# Altium project Стенд проверки шлейфов.PrjPcb
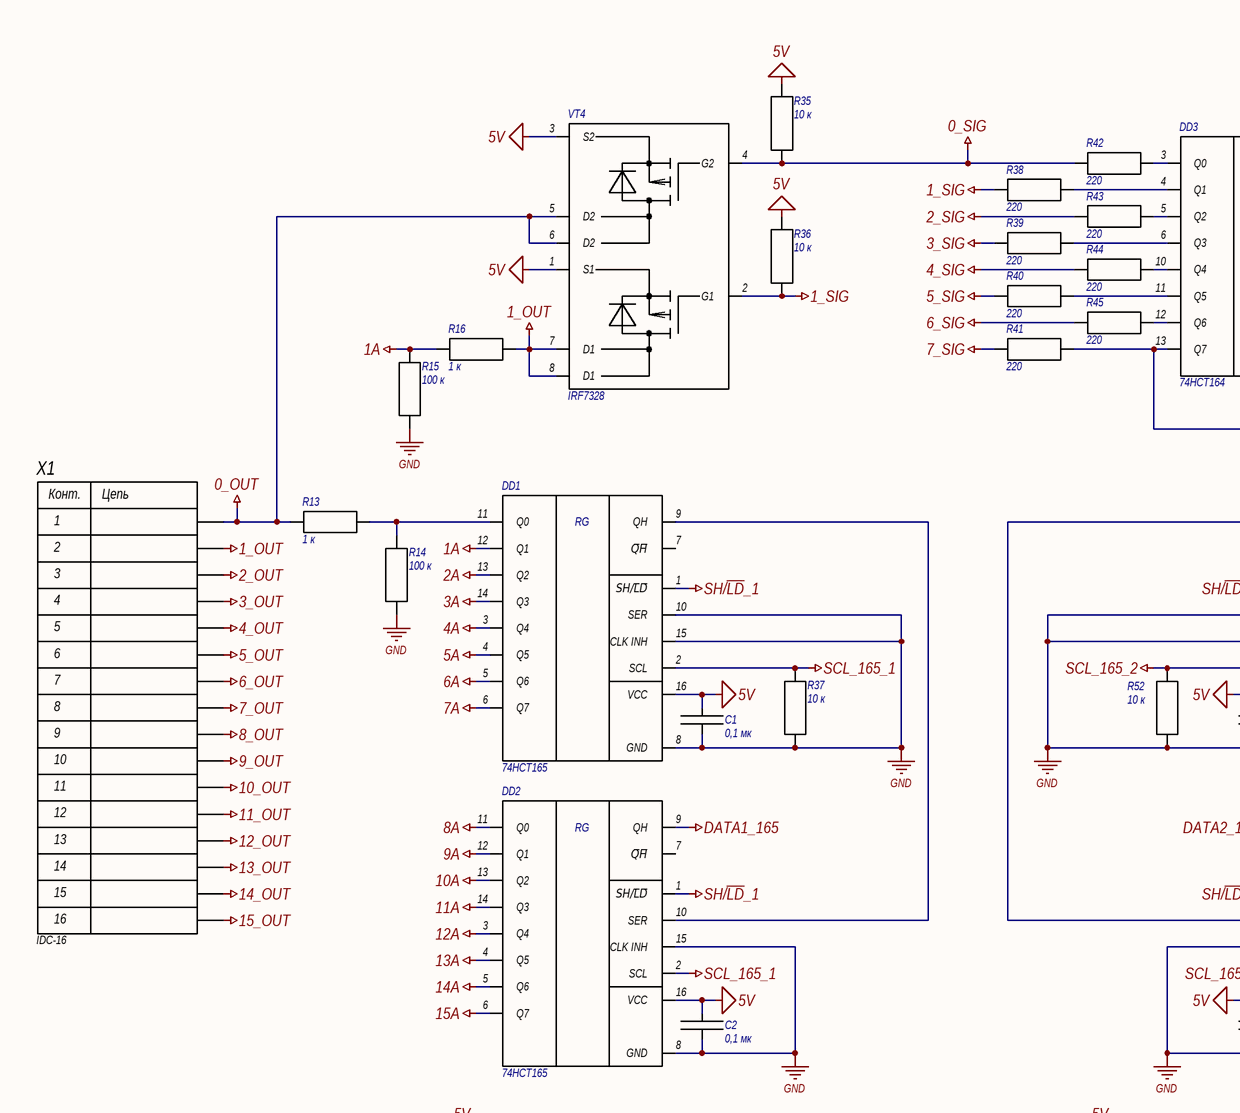
[diagram p0: Схема проверки шлейфа.SchDoc, top left]
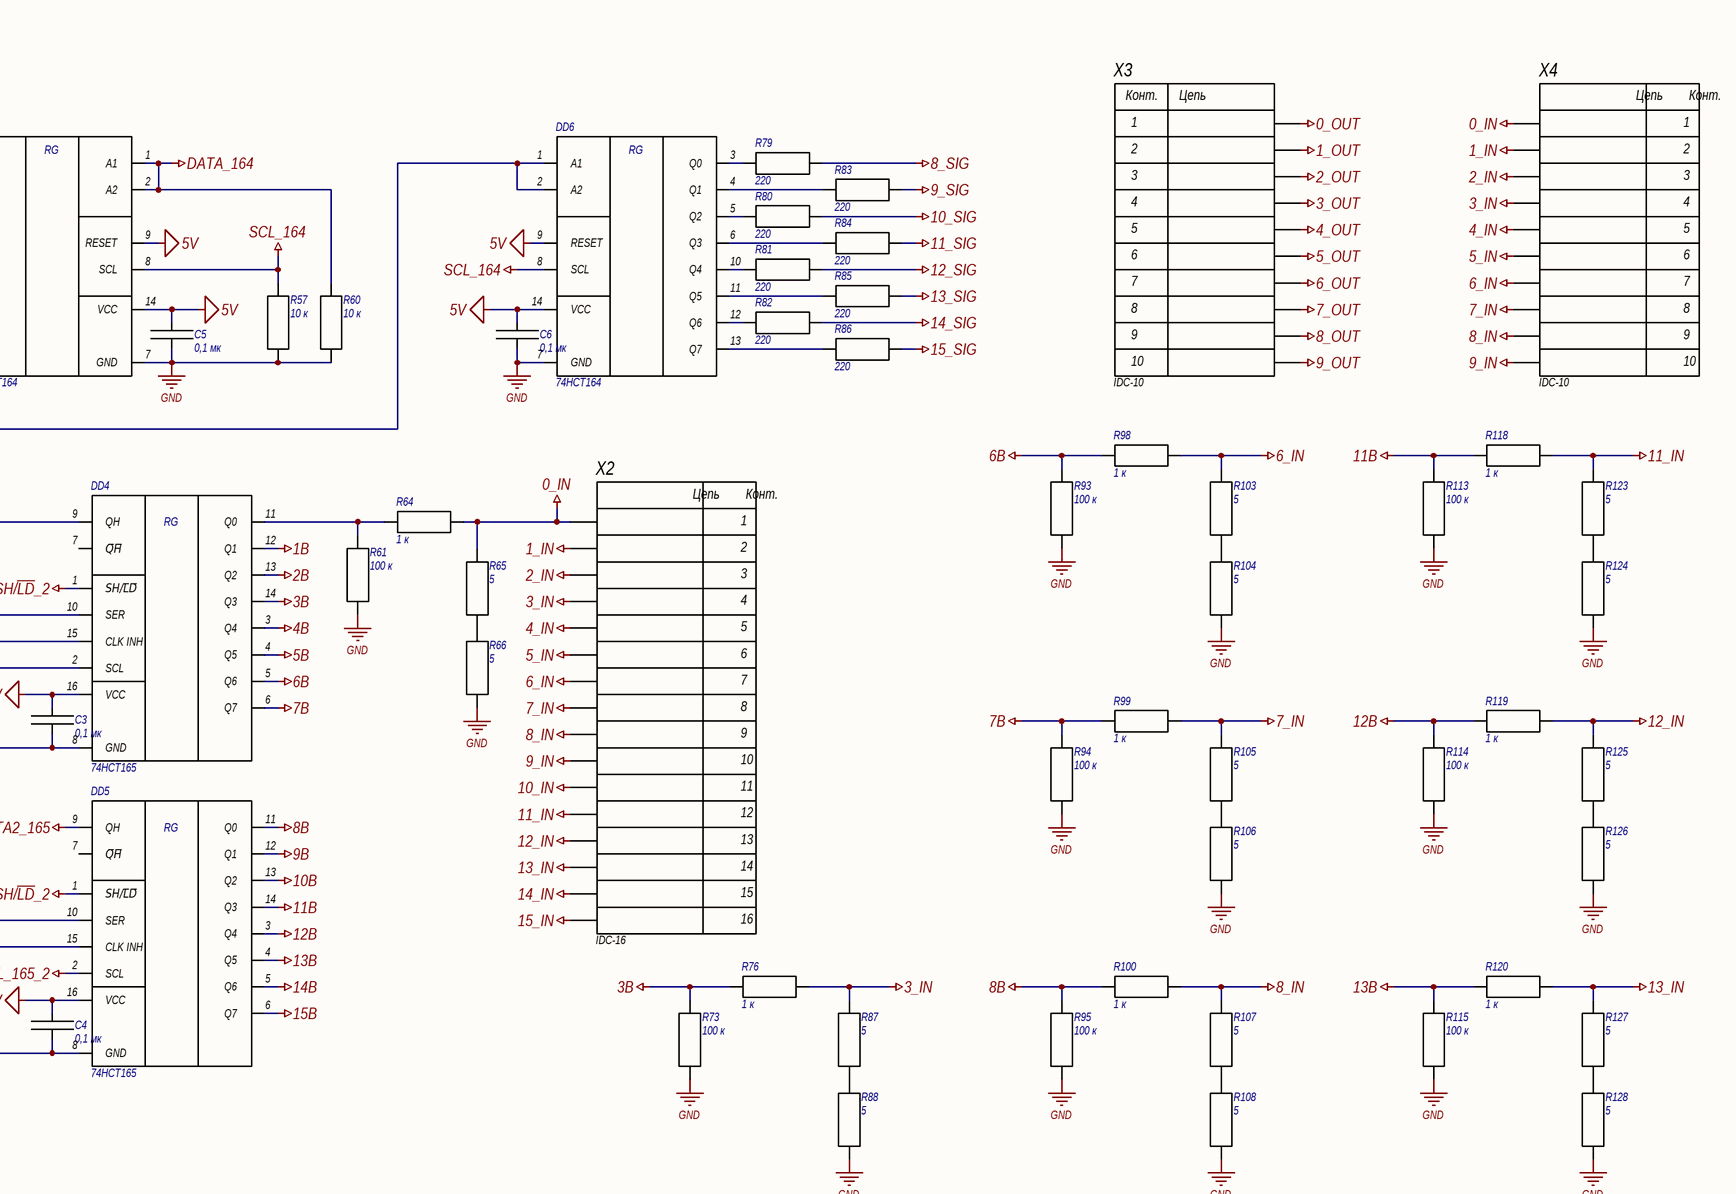
[diagram p1: Схема проверки шлейфа.SchDoc, top right]
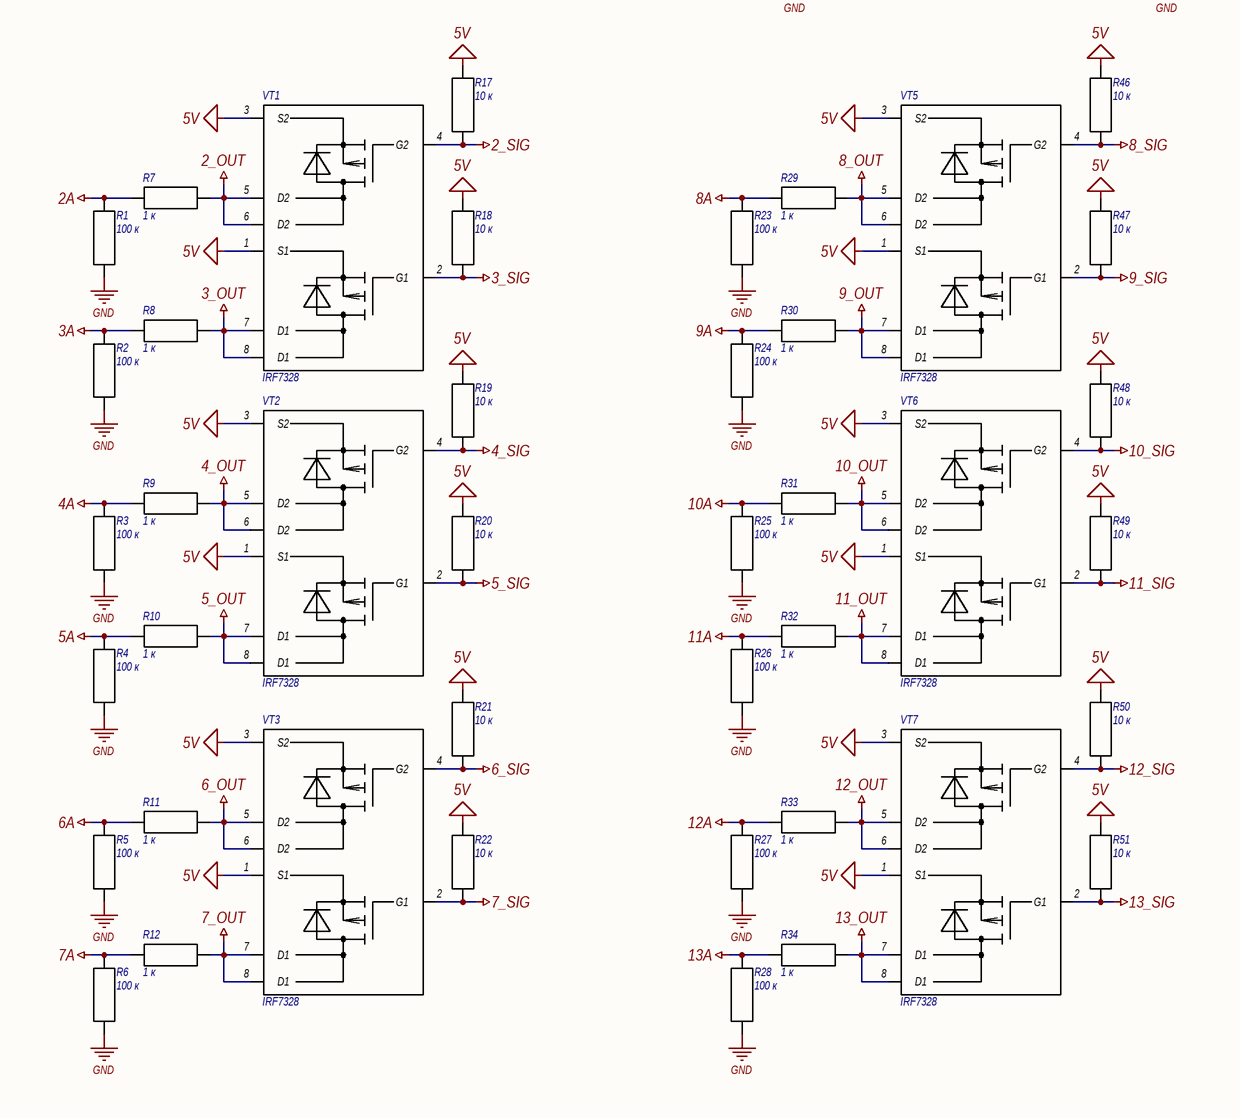
[diagram p2: Схема проверки шлейфа.SchDoc, bottom left]
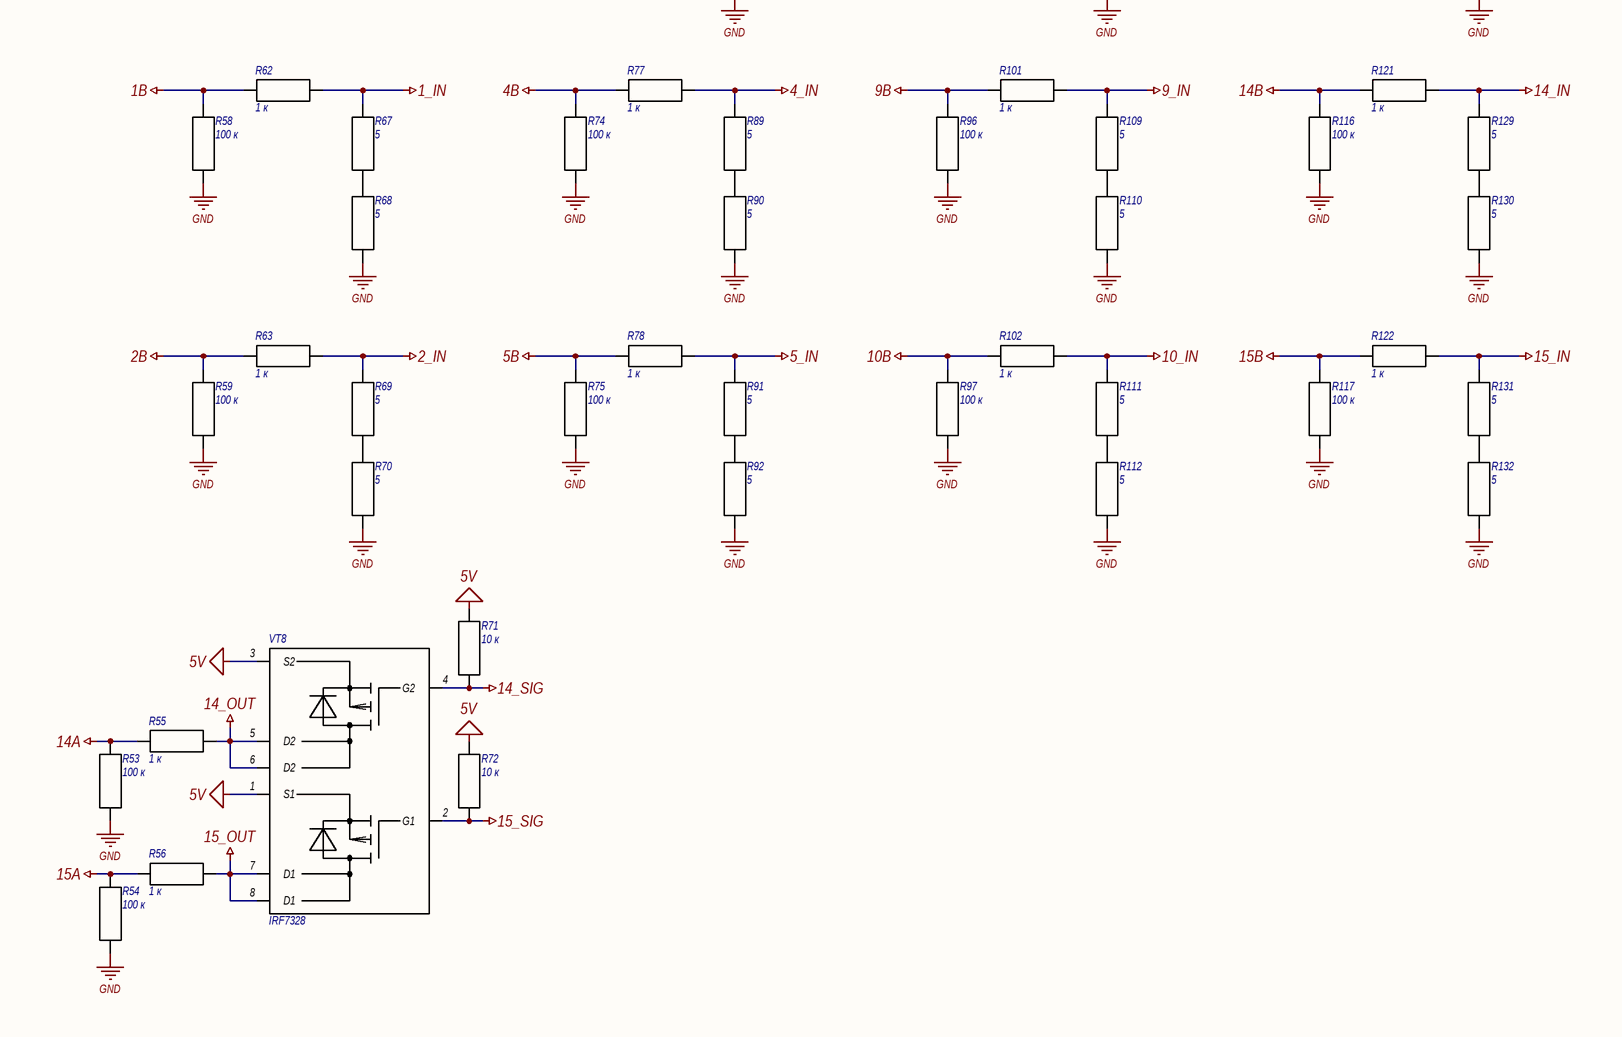
[diagram p3: Схема проверки шлейфа.SchDoc, bottom right]
2 sheets, 262 parts. Net scope: global (net labels, ports and power ports of the same name join across sheets).
Board file: Стенд проверки шлейфов.PcbDoc
Sheets:
  Схема проверки шлейфа.SchDoc
  Проц, ввод вывод, питание.SchDoc

## Sheet Схема проверки шлейфа.SchDoc
size 594 x 420 mm; CheckedBy: Проверил; SheetNumber: 1; SheetTotal: 2; _Razrabotal: Рябышев; _Naimenovanie1: Стенд проверки шлейфов; _Naimenovanie4: v1.0; _Predprijatie: ООО "ПРОТОН"; _List: 1; _Listov: 2

### Parts
C1  0,1 мк  [CCAP0603]
C2  0,1 мк  [CCAP0603]
C3  0,1 мк  [CCAP0603]
C4  0,1 мк  [CCAP0603]
C5  0,1 мк  [CCAP0603]
C6  0,1 мк  [CCAP0603]
DD1  74HCT165  [SOIC16 9.9x3.9]
DD2  74HCT165  [SOIC16 9.9x3.9]
DD3  74HCT164  [SOIC14 8.6x3.9]
DD4  74HCT165  [SOIC16 9.9x3.9]
DD5  74HCT165  [SOIC16 9.9x3.9]
DD6  74HCT164  [SOIC14 8.6x3.9]
R1  100 к  [RES0805]
R2  100 к  [RES0805]
R3  100 к  [RES0805]
R4  100 к  [RES0805]
R5  100 к  [RES0805]
R6  100 к  [RES0805]
R7  1 к  [RES0805]
R8  1 к  [RES0805]
R9  1 к  [RES0805]
R10  1 к  [RES0805]
R11  1 к  [RES0805]
R12  1 к  [RES0805]
R13  1 к  [RES0805]
R14  100 к  [RES0805]
R15  100 к  [RES0805]
R16  1 к  [RES0805]
R17  10 к  [RES0805]
R18  10 к  [RES0805]
R19  10 к  [RES0805]
R20  10 к  [RES0805]
R21  10 к  [RES0805]
R22  10 к  [RES0805]
R23  100 к  [RES0805]
R24  100 к  [RES0805]
R25  100 к  [RES0805]
R26  100 к  [RES0805]
R27  100 к  [RES0805]
R28  100 к  [RES0805]
R29  1 к  [RES0805]
R30  1 к  [RES0805]
R31  1 к  [RES0805]
R32  1 к  [RES0805]
R33  1 к  [RES0805]
R34  1 к  [RES0805]
R35  10 к  [RES0805]
R36  10 к  [RES0805]
R37  10 к  [RES0805]
R38  220  [RES0805]
R39  220  [RES0805]
R40  220  [RES0805]
R41  220  [RES0805]
R42  220  [RES0805]
R43  220  [RES0805]
R44  220  [RES0805]
R45  220  [RES0805]
R46  10 к  [RES0805]
R47  10 к  [RES0805]
R48  10 к  [RES0805]
R49  10 к  [RES0805]
R50  10 к  [RES0805]
R51  10 к  [RES0805]
R52  10 к  [RES0603]
R53  100 к  [RES0805]
R54  100 к  [RES0805]
R55  1 к  [RES0805]
R56  1 к  [RES0805]
R57  10 к  [RES0805]
R58  100 к  [RES0603]
R59  100 к  [RES0603]
R60  10 к  [RES0805]
R61  100 к  [RES0603]
R62  1 к  [RES0603]
R63  1 к  [RES0603]
R64  1 к  [RES0603]
R65  5  [RES2512]
R66  5  [RES2512]
R67  5  [RES2512]
R68  5  [RES2512]
R69  5  [RES2512]
R70  5  [RES2512]
R71  10 к  [RES0805]
R72  10 к  [RES0805]
R73  100 к  [RES0603]
R74  100 к  [RES0603]
R75  100 к  [RES0603]
R76  1 к  [RES0603]
R77  1 к  [RES0603]
R78  1 к  [RES0603]
R79  220  [RES0805]
R80  220  [RES0805]
R81  220  [RES0805]
R82  220  [RES0805]
R83  220  [RES0805]
R84  220  [RES0805]
R85  220  [RES0805]
R86  220  [RES0805]
R87  5  [RES2512]
R88  5  [RES2512]
R89  5  [RES2512]
R90  5  [RES2512]
R91  5  [RES2512]
R92  5  [RES2512]
R93  100 к  [RES0603]
R94  100 к  [RES0603]
R95  100 к  [RES0603]
R96  100 к  [RES0603]
R97  100 к  [RES0603]
R98  1 к  [RES0603]
R99  1 к  [RES0603]
R100  1 к  [RES0603]
R101  1 к  [RES0603]
R102  1 к  [RES0603]
R103  5  [RES2512]
R104  5  [RES2512]
R105  5  [RES2512]
R106  5  [RES2512]
R107  5  [RES2512]
R108  5  [RES2512]
R109  5  [RES2512]
R110  5  [RES2512]
R111  5  [RES2512]
R112  5  [RES2512]
R113  100 к  [RES0603]
R114  100 к  [RES0603]
R115  100 к  [RES0603]
R116  100 к  [RES0603]
R117  100 к  [RES0603]
R118  1 к  [RES0603]
R119  1 к  [RES0603]
R120  1 к  [RES0603]
R121  1 к  [RES0603]
R122  1 к  [RES0603]
R123  5  [RES2512]
R124  5  [RES2512]
R125  5  [RES2512]
R126  5  [RES2512]
R127  5  [RES2512]
R128  5  [RES2512]
R129  5  [RES2512]
R130  5  [RES2512]
R131  5  [RES2512]
R132  5  [RES2512]
VT1  IRF7328  [SOIC8 4.9x3.9]
VT2  IRF7328  [SOIC8 4.9x3.9]
VT3  IRF7328  [SOIC8 4.9x3.9]
VT4  IRF7328  [SOIC8 4.9x3.9]
VT5  IRF7328  [SOIC8 4.9x3.9]
VT6  IRF7328  [SOIC8 4.9x3.9]
VT7  IRF7328  [SOIC8 4.9x3.9]
VT8  IRF7328  [SOIC8 4.9x3.9]
X1  IDC-16  [IDC-16]
X2  IDC-16  [IDC-16]
X3  IDC-10  [IDC-10]
X4  IDC-10  [IDC-10]

### Nets
0_IN: R64.1 R65.1 X2.1 X4.1
0_OUT: R13.1 VT4.5(D2) VT4.6(D2) X1.1 X3.1
0_SIG: R35.1 R42.1 VT4.4(G2)
1_IN: R62.1 R67.1 X2.2 X4.2
1_OUT: R16.1 VT4.7(D1) VT4.8(D1) X1.2 X3.2
1_SIG: R36.1 R38.1 VT4.2(G1)
1А: DD1.12(Q1) R15.1 R16.2
1В: DD4.12(Q1) R58.1 R62.2
2_IN: R63.1 R69.1 X2.3 X4.3
2_OUT: R7.1 VT1.5(D2) VT1.6(D2) X1.3 X3.3
2_SIG: R17.1 R43.1 VT1.4(G2)
2А: DD1.13(Q2) R1.1 R7.2
2В: DD4.13(Q2) R59.1 R63.2
3_IN: R76.1 R87.1 X2.4 X4.4
3_OUT: R8.1 VT1.7(D1) VT1.8(D1) X1.4 X3.4
3_SIG: R18.1 R39.1 VT1.2(G1)
3А: DD1.14(Q3) R2.1 R8.2
3В: DD4.14(Q3) R73.1 R76.2
4_IN: R77.1 R89.1 X2.5 X4.5
4_OUT: R9.1 VT2.5(D2) VT2.6(D2) X1.5 X3.5
4_SIG: R19.1 R44.1 VT2.4(G2)
4А: DD1.3(Q4) R3.1 R9.2
4В: DD4.3(Q4) R74.1 R77.2
5_IN: R78.1 R91.1 X2.6 X4.6
5_OUT: R10.1 VT2.7(D1) VT2.8(D1) X1.6 X3.6
5_SIG: R20.1 R40.1 VT2.2(G1)
5V: C1.1 C2.1 C3.1 C4.1 C5.1 C6.1 DD1.16(VCC) DD2.16(VCC) DD3.9(RESET) DD3.14(VCC) DD4.16(VCC) DD5.16(VCC) DD6.9(RESET) DD6.14(VCC) R17.2 R18.2 R19.2 R20.2 R21.2 R22.2 R35.2 R36.2 R46.2 R47.2 R48.2 R49.2 R50.2 R51.2 R71.2 R72.2 VT1.1(S1) VT1.3(S2) VT2.1(S1) VT2.3(S2) VT3.1(S1) VT3.3(S2) VT4.1(S1) VT4.3(S2) VT5.1(S1) VT5.3(S2) VT6.1(S1) VT6.3(S2) VT7.1(S1) VT7.3(S2) VT8.1(S1) VT8.3(S2)
5А: DD1.4(Q5) R4.1 R10.2
5В: DD4.4(Q5) R75.1 R78.2
6_IN: R98.1 R103.1 X2.7 X4.7
6_OUT: R11.1 VT3.5(D2) VT3.6(D2) X1.7 X3.7
6_SIG: R21.1 R45.1 VT3.4(G2)
6А: DD1.5(Q6) R5.1 R11.2
6В: DD4.5(Q6) R93.1 R98.2
7_IN: R99.1 R105.1 X2.8 X4.8
7_OUT: R12.1 VT3.7(D1) VT3.8(D1) X1.8 X3.8
7_SIG: R22.1 R41.1 VT3.2(G1)
7А: DD1.6(Q7) R6.1 R12.2
7В: DD4.6(Q7) R94.1 R99.2
8_IN: R100.1 R107.1 X2.9 X4.9
8_OUT: R29.1 VT5.5(D2) VT5.6(D2) X1.9 X3.9
8_SIG: R46.1 R79.1 VT5.4(G2)
8А: DD2.11(Q0) R23.1 R29.2
8В: DD5.11(Q0) R95.1 R100.2
9_IN: R101.1 R109.1 X2.10 X4.10
9_OUT: R30.1 VT5.7(D1) VT5.8(D1) X1.10 X3.10
9_SIG: R47.1 R83.1 VT5.2(G1)
9А: DD2.12(Q1) R24.1 R30.2
9В: DD5.12(Q1) R96.1 R101.2
10_IN: R102.1 R111.1 X2.11
10_OUT: R31.1 VT6.5(D2) VT6.6(D2) X1.11
10_SIG: R48.1 R80.1 VT6.4(G2)
10А: DD2.13(Q2) R25.1 R31.2
10В: DD5.13(Q2) R97.1 R102.2
11_IN: R118.1 R123.1 X2.12
11_OUT: R32.1 VT6.7(D1) VT6.8(D1) X1.12
11_SIG: R49.1 R84.1 VT6.2(G1)
11А: DD2.14(Q3) R26.1 R32.2
11В: DD5.14(Q3) R113.1 R118.2
12_IN: R119.1 R125.1 X2.13
12_OUT: R33.1 VT7.5(D2) VT7.6(D2) X1.13
12_SIG: R50.1 R81.1 VT7.4(G2)
12А: DD2.3(Q4) R27.1 R33.2
12В: DD5.3(Q4) R114.1 R119.2
13_IN: R120.1 R127.1 X2.14
13_OUT: R34.1 VT7.7(D1) VT7.8(D1) X1.14
13_SIG: R51.1 R85.1 VT7.2(G1)
13А: DD2.4(Q5) R28.1 R34.2
13В: DD5.4(Q5) R115.1 R120.2
14_IN: R121.1 R129.1 X2.15
14_OUT: R55.1 VT8.5(D2) VT8.6(D2) X1.15
14_SIG: R71.1 R82.1 VT8.4(G2)
14А: DD2.5(Q6) R53.1 R55.2
14В: DD5.5(Q6) R116.1 R121.2
15_IN: R122.1 R131.1 X2.16
15_OUT: R56.1 VT8.7(D1) VT8.8(D1) X1.16
15_SIG: R72.1 R86.1 VT8.2(G1)
15А: DD2.6(Q7) R54.1 R56.2
15В: DD5.6(Q7) R117.1 R122.2
DATA1_165: DD2.9(QH)
DATA2_165: DD5.9(QH)
DATA_164: DD3.1(A1) DD3.2(A2) R60.2
GND: C1.2 C2.2 C3.2 C4.2 C5.2 C6.2 DD1.8(GND) DD1.10(SER) DD1.15(CLK_INH) DD2.8(GND) DD2.15(CLK_INH) DD3.7(GND) DD4.8(GND) DD4.10(SER) DD4.15(CLK_INH) DD5.8(GND) DD5.15(CLK_INH) DD6.7(GND) R1.2 R2.2 R3.2 R4.2 R5.2 R6.2 R14.2 R15.2 R23.2 R24.2 R25.2 R26.2 R27.2 R28.2 R37.1 R52.1 R53.2 R54.2 R57.1 R58.2 R59.2 R60.1 R61.2 R66.2 R68.2 R70.2 R73.2 R74.2 R75.2 R88.2 R90.2 R92.2 R93.2 R94.2 R95.2 R96.2 R97.2 R104.2 R106.2 R108.2 R110.2 R112.2 R113.2 R114.2 R115.2 R116.2 R117.2 R124.2 R126.2 R128.2 R130.2 R132.2
SCL_164: DD3.8(SCL) DD6.8(SCL) R57.2
SCL_165_1: DD1.2(SCL) DD2.2(SCL) R37.2
SCL_165_2: DD4.2(SCL) DD5.2(SCL) R52.2
SH/~{LD}_1: DD1.1(SH/L̅D̅) DD2.1(SH/L̅D̅)
SH/~{LD}_2: DD4.1(SH/L̅D̅) DD5.1(SH/L̅D̅)
NetDD1_9: DD1.9(QH) DD2.10(SER)
NetDD1_11: DD1.11(Q0) R13.2 R14.1
NetDD3_3: DD3.3(Q0) R42.2
NetDD3_4: DD3.4(Q1) R38.2
NetDD3_5: DD3.5(Q2) R43.2
NetDD3_6: DD3.6(Q3) R39.2
NetDD3_10: DD3.10(Q4) R44.2
NetDD3_11: DD3.11(Q5) R40.2
NetDD3_12: DD3.12(Q6) R45.2
NetDD3_13: DD3.13(Q7) DD6.1(A1) DD6.2(A2) R41.2
NetDD4_9: DD4.9(QH) DD5.10(SER)
NetDD4_11: DD4.11(Q0) R61.1 R64.2
NetDD6_3: DD6.3(Q0) R79.2
NetDD6_4: DD6.4(Q1) R83.2
NetDD6_5: DD6.5(Q2) R80.2
NetDD6_6: DD6.6(Q3) R84.2
NetDD6_10: DD6.10(Q4) R81.2
NetDD6_11: DD6.11(Q5) R85.2
NetDD6_12: DD6.12(Q6) R82.2
NetDD6_13: DD6.13(Q7) R86.2
NetR65_2: R65.2 R66.1
NetR67_2: R67.2 R68.1
NetR69_2: R69.2 R70.1
NetR87_2: R87.2 R88.1
NetR89_2: R89.2 R90.1
NetR91_2: R91.2 R92.1
NetR103_2: R103.2 R104.1
NetR105_2: R105.2 R106.1
NetR107_2: R107.2 R108.1
NetR109_2: R109.2 R110.1
NetR111_2: R111.2 R112.1
NetR123_2: R123.2 R124.1
NetR125_2: R125.2 R126.1
NetR127_2: R127.2 R128.1
NetR129_2: R129.2 R130.1
NetR131_2: R131.2 R132.1

Not connected (* = marked no-connect by the designer): DD1 7(Q̅H̅); DD2 7(Q̅H̅); DD4 7(Q̅H̅); DD5 7(Q̅H̅)

### Notes on the sheet
- Перв. примен.
- Справ. №
- Подп. и дата
- Инв. № дубл.
- Взам. инв. №
- Разраб.
- Изм.
- Лист
- № докум.
- Подп.
- Дата
- Лит.
- Масса
- Масштаб
- Пров.
- Т.контр.
- Листов
- Инв. № подл.
- Утв.
- Н.контр.
- Копировал
- Формат  A2
- (in symbol 16_Pin) Конт.; Цепь
- (in symbol 74HC164) RG
- (in symbol 74HC165) RG
- (in symbol IDC-10) Конт.; Цепь

### Library data of the parts
C1-C6 = Конденсатор: C0603 0,1 мкФ 50В X7R
DD1 DD2 DD4 DD5 = 74HC165: 74HCT165D (SOIC-16) /
DD3 DD6 = 74HC164: 74HCT164D (SOIC-14)
R1-R6 R14 R15 R23-R28 R53 R54 = Резистор: R0805 100 кОм ±5%
R7-R13 R16 R29-R34 R55 R56 = Резистор: R0805 1 кОм ±5%
R17-R22 R35-R37 R46-R51 R57 R60 R71 R72 = Резистор: R0805 10 кОм ±5%
R38-R45 R79-R86 = Резистор: R0805 220 Ом ±5%
R52 = Резистор: R0603 10 кОм ±5%
R58 R59 R61 R73-R75 R93-R97 R113-R117 = Резистор: R0603 100 кОм ±5%
R62-R64 R76-R78 R98-R102 R118-R122 = Резистор: R0603 1 кОм ±5%
R65-R70 R87-R92 R103-R112 R123-R132 = Резистор: R2512 5 Ом ±5%
VT1-VT8 = IRF7342: IRF7328 (SOP-8)
X1 X2 = 16_Pin: Value: Pad; HelpURL: *; Price: *
X3 X4 = IDC-10: Value: IDC-10

## Sheet Проц, ввод вывод, питание.SchDoc
size 594 x 420 mm; CheckedBy: Проверил; _List: 2
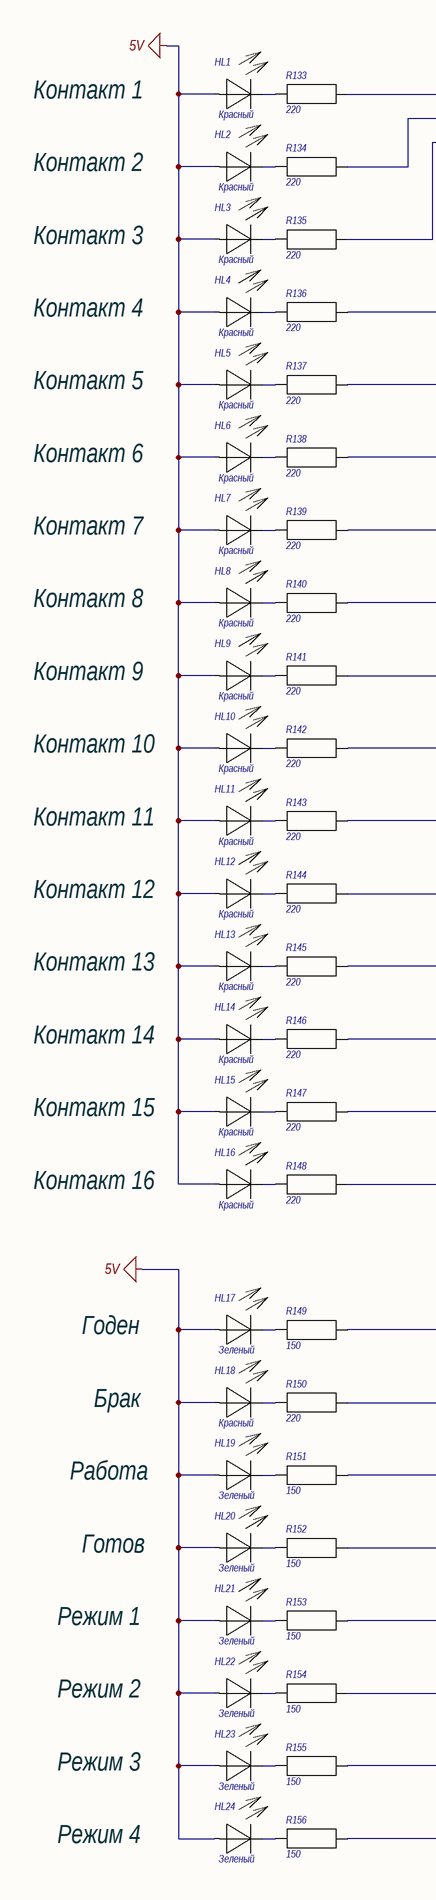
[diagram p4: Проц, ввод вывод, питание.SchDoc, left]
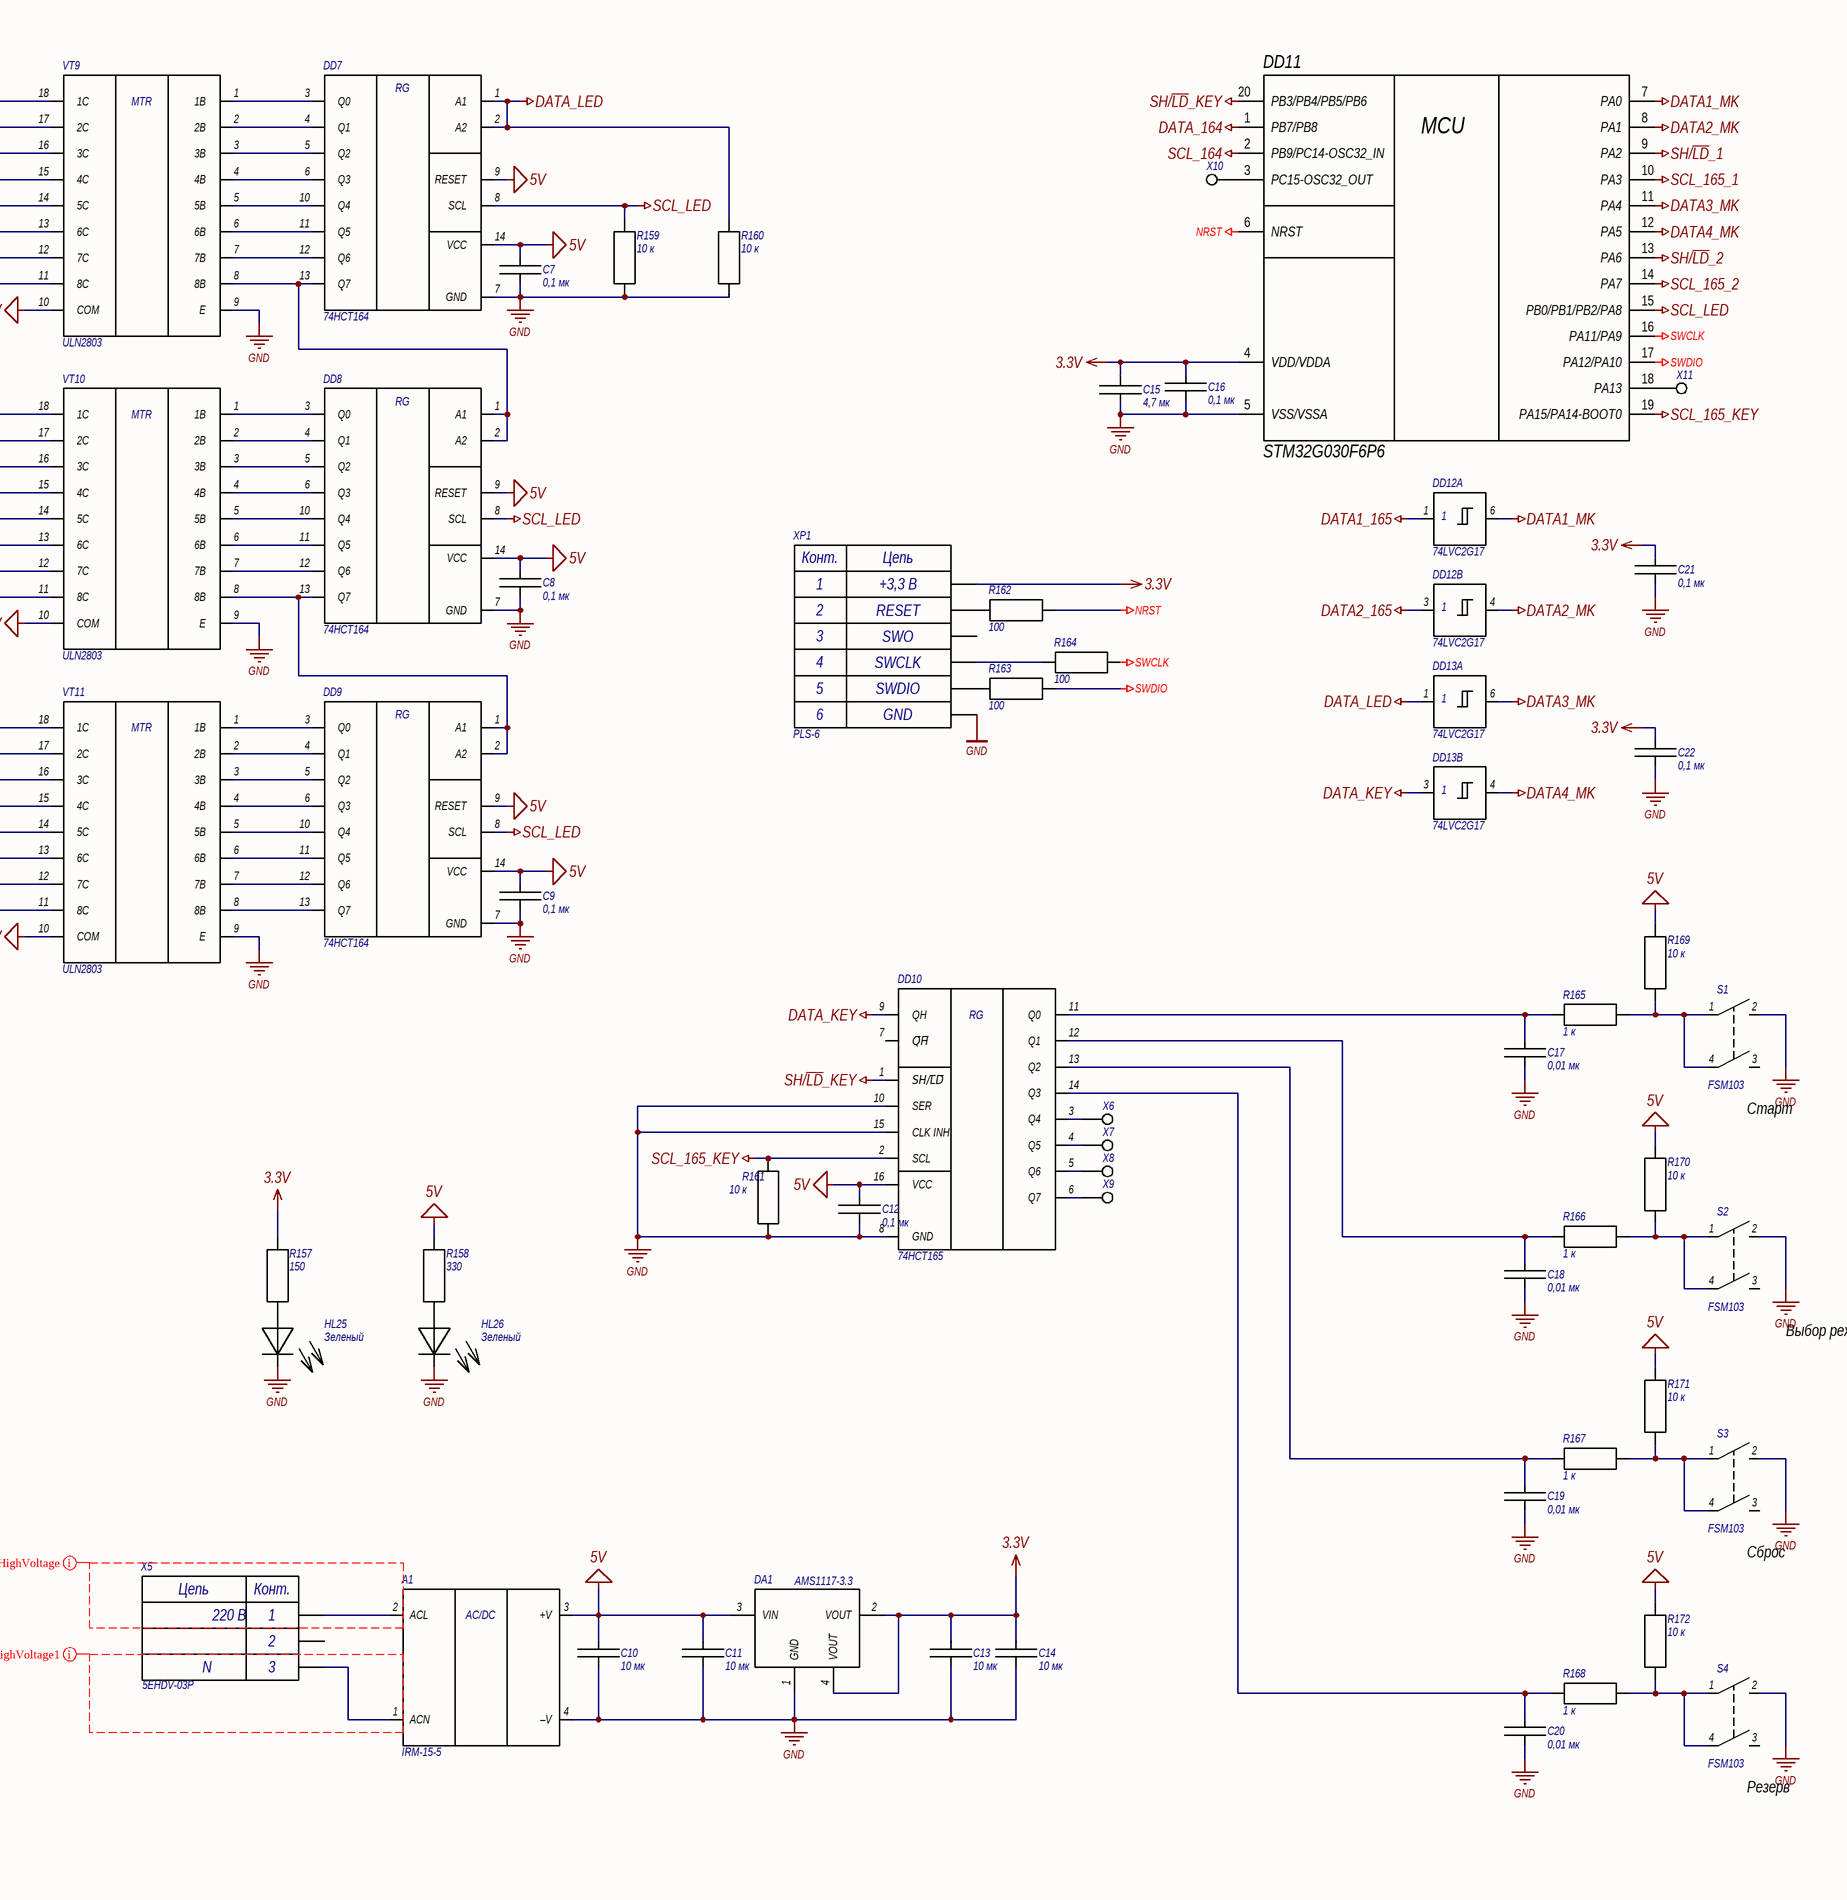
[diagram p5: Проц, ввод вывод, питание.SchDoc, right]

### Parts
A1  IRM-15-5  [IRM-15-5]
C7  0,1 мк  [CCAP0603]
C8  0,1 мк  [CCAP0603]
C9  0,1 мк  [CCAP0603]
C10  10 мк  [CCAP0603]
C11  10 мк  [CCAP0603]
C12  0,1 мк  [CCAP0603]
C13  10 мк  [CCAP0603]
C14  10 мк  [CCAP0603]
C15  4,7 мк  [CCAP0603]
C16  0,1 мк  [CCAP0603]
C17  0,01 мк  [CCAP0603]
C18  0,01 мк  [CCAP0603]
C19  0,01 мк  [CCAP0603]
C20  0,01 мк  [CCAP0603]
C21  0,1 мк  [CCAP0603]
C22  0,1 мк  [CCAP0603]
DA1  AMS1117-3.3  [SOT223-4 6.5x3.5]  (no BOM)
DD7  74HCT164  [SOIC14 8.6x3.9]
DD8  74HCT164  [SOIC14 8.6x3.9]
DD9  74HCT164  [SOIC14 8.6x3.9]
DD10  74HCT165  [SOIC16 9.9x3.9]
DD11  STM32G030F6P6  [TSSOP-20 (6.5x4.4)]
DD12  74LVC2G17  [SOT23-6 2.9x1.6]  (parts A,B of 2)
DD13  74LVC2G17  [SOT23-6 2.9x1.6]  (parts A,B of 2)
HL1  Красный  [LED RED 5MM]
HL2  Красный  [LED RED 5MM]
HL3  Красный  [LED RED 5MM]
HL4  Красный  [LED RED 5MM]
HL5  Красный  [LED RED 5MM]
HL6  Красный  [LED RED 5MM]
HL7  Красный  [LED RED 5MM]
HL8  Красный  [LED RED 5MM]
HL9  Красный  [LED RED 5MM]
HL10  Красный  [LED RED 5MM]
HL11  Красный  [LED RED 5MM]
HL12  Красный  [LED RED 5MM]
HL13  Красный  [LED RED 5MM]
HL14  Красный  [LED RED 5MM]
HL15  Красный  [LED RED 5MM]
HL16  Красный  [LED RED 5MM]
HL17  Зеленый  [LED GREEN 5MM]
HL18  Красный  [LED RED 5MM]
HL19  Зеленый  [LED GREEN 5MM]
HL20  Зеленый  [LED GREEN 5MM]
HL21  Зеленый  [LED GREEN 5MM]
HL22  Зеленый  [LED GREEN 5MM]
HL23  Зеленый  [LED GREEN 5MM]
HL24  Зеленый  [LED GREEN 5MM]
HL25  Зеленый  [LED GREEN 5MM]
HL26  Зеленый  [LED GREEN 5MM]
R133  220  [RES0805]
R134  220  [RES0805]
R135  220  [RES0805]
R136  220  [RES0805]
R137  220  [RES0805]
R138  220  [RES0805]
R139  220  [RES0805]
R140  220  [RES0805]
R141  220  [RES0805]
R142  220  [RES0805]
R143  220  [RES0805]
R144  220  [RES0805]
R145  220  [RES0805]
R146  220  [RES0805]
R147  220  [RES0805]
R148  220  [RES0805]
R149  150  [RES0805]
R150  220  [RES0805]
R151  150  [RES0805]
R152  150  [RES0805]
R153  150  [RES0805]
R154  150  [RES0805]
R155  150  [RES0805]
R156  150  [RES0805]
R157  150  [RES0805]
R158  330  [RES0805]
R159  10 к  [RES0805]
R160  10 к  [RES0805]
R161  10 к  [RES0805]
R162  100  [RES0603]
R163  100  [RES0603]
R164  100  [RES0603]
R165  1 к  [RES0805]
R166  1 к  [RES0805]
R167  1 к  [RES0805]
R168  1 к  [RES0805]
R169  10 к  [RES0805]
R170  10 к  [RES0805]
R171  10 к  [RES0805]
R172  10 к  [RES0805]
S1  FSM103  [PBUT3]
S2  FSM103  [PBUT3]
S3  FSM103  [PBUT3]
S4  FSM103  [PBUT3]
VT9  ULN2803  [IC_ULN2803ADW]
VT10  ULN2803  [IC_ULN2803ADW]
VT11  ULN2803  [IC_ULN2803ADW]
X5  5EHDV-03P  [MSTB3]
X6  (no value)  [Контакт 0,8 мм]  (no BOM)
X7  (no value)  [Контакт 0,8 мм]  (no BOM)
X8  (no value)  [Контакт 0,8 мм]  (no BOM)
X9  (no value)  [Контакт 0,8 мм]  (no BOM)
X10  (no value)  [Контакт 0,8 мм]  (no BOM)
X11  (no value)  [Контакт 0,8 мм]  (no BOM)
XP1  PLS-6  [PLS-6]

### Nets
3.3V: C13.1 C14.1 C15.2 C16.1 C21.1 C22.1 DA1.2(VOUT) DA1.4(VOUT) DD11.4(VDD/VDDA) R157.1 XP1.1
5V: A1.3(+V) C7.1 C8.1 C9.1 C10.1 C11.1 C12.1 DA1.3(VIN) DD7.9(RESET) DD7.14(VCC) DD8.9(RESET) DD8.14(VCC) DD9.9(RESET) DD9.14(VCC) DD10.16(VCC) HL1.2(A) HL2.2(A) HL3.2(A) HL4.2(A) HL5.2(A) HL6.2(A) HL7.2(A) HL8.2(A) HL9.2(A) HL10.2(A) HL11.2(A) HL12.2(A) HL13.2(A) HL14.2(A) HL15.2(A) HL16.2(A) HL17.2(A) HL18.2(A) HL19.2(A) HL20.2(A) HL21.2(A) HL22.2(A) HL23.2(A) HL24.2(A) R158.1 R169.1 R170.1 R171.1 R172.1 VT9.10(COM) VT10.10(COM) VT11.10(COM)
DATA1_165: DD12.1(1A)
DATA1_MK: DD11.7(PA0) DD12.6(1Y)
DATA2_165: DD12.3(2A)
DATA2_MK: DD11.8(PA1) DD12.4(2Y)
DATA3_MK: DD11.11(PA4) DD13.6(1Y)
DATA4_MK: DD11.12(PA5) DD13.4(2Y)
DATA_164: DD11.1(PB7/PB8)
DATA_KEY: DD10.9(QH) DD13.3(2A)
DATA_LED: DD7.1(A1) DD7.2(A2) DD13.1(1A) R160.2
GND: A1.4(–V) C7.2 C8.2 C9.2 C10.2 C11.2 C12.2 C13.2 C14.2 C15.1 C16.2 C17.2 C18.2 C19.2 C20.2 C21.2 C22.2 DA1.1(GND) DD7.7(GND) DD8.7(GND) DD9.7(GND) DD10.8(GND) DD10.10(SER) DD10.15(CLK_INH) DD11.5(VSS/VSSA) HL25.1(C) HL26.1(C) R159.1 R160.1 R161.1 S1.2 S2.2 S3.2 S4.2 VT9.9(E) VT10.9(E) VT11.9(E) XP1.6
NRST: DD11.6(NRST) R162.2
SCL_164: DD11.2(PB9/PC14-OSC32_IN)
SCL_165_1: DD11.10(PA3)
SCL_165_2: DD11.14(PA7)
SCL_165_KEY: DD10.2(SCL) DD11.19(PA15/PA14-BOOT0) R161.2
SCL_LED: DD7.8(SCL) DD8.8(SCL) DD9.8(SCL) DD11.15(PB0/PB1/PB2/PA8) R159.2
SH/~{LD}_1: DD11.9(PA2)
SH/~{LD}_2: DD11.13(PA6)
SH/~{LD}_KEY: DD10.1(SH/L̅D̅) DD11.20(PB3/PB4/PB5/PB6)
SWCLK: DD11.16(PA11/PA9) R164.2
SWDIO: DD11.17(PA12/PA10) R163.2
NetA1_1: A1.1(ACN) X5.3
NetA1_2: A1.2(ACL) X5.1
NetC17_1: C17.1 DD10.11(Q0) R165.2
NetC18_1: C18.1 DD10.12(Q1) R166.2
NetC19_1: C19.1 DD10.13(Q2) R167.2
NetC20_1: C20.1 DD10.14(Q3) R168.2
NetDD7_3: DD7.3(Q0) VT9.1(1B)
NetDD7_4: DD7.4(Q1) VT9.2(2B)
NetDD7_5: DD7.5(Q2) VT9.3(3B)
NetDD7_6: DD7.6(Q3) VT9.4(4B)
NetDD7_10: DD7.10(Q4) VT9.5(5B)
NetDD7_11: DD7.11(Q5) VT9.6(6B)
NetDD7_12: DD7.12(Q6) VT9.7(7B)
NetDD7_13: DD7.13(Q7) DD8.1(A1) DD8.2(A2) VT9.8(8B)
NetDD8_3: DD8.3(Q0) VT10.1(1B)
NetDD8_4: DD8.4(Q1) VT10.2(2B)
NetDD8_5: DD8.5(Q2) VT10.3(3B)
NetDD8_6: DD8.6(Q3) VT10.4(4B)
NetDD8_10: DD8.10(Q4) VT10.5(5B)
NetDD8_11: DD8.11(Q5) VT10.6(6B)
NetDD8_12: DD8.12(Q6) VT10.7(7B)
NetDD8_13: DD8.13(Q7) DD9.1(A1) DD9.2(A2) VT10.8(8B)
NetDD9_3: DD9.3(Q0) VT11.1(1B)
NetDD9_4: DD9.4(Q1) VT11.2(2B)
NetDD9_5: DD9.5(Q2) VT11.3(3B)
NetDD9_6: DD9.6(Q3) VT11.4(4B)
NetDD9_10: DD9.10(Q4) VT11.5(5B)
NetDD9_11: DD9.11(Q5) VT11.6(6B)
NetDD9_12: DD9.12(Q6) VT11.7(7B)
NetDD9_13: DD9.13(Q7) VT11.8(8B)
NetDD10_3: DD10.3(Q4) X6.1
NetDD10_4: DD10.4(Q5) X7.1
NetDD10_5: DD10.5(Q6) X8.1
NetDD10_6: DD10.6(Q7) X9.1
NetDD11_3: DD11.3(PC15-OSC32_OUT) X10.1
NetDD11_18: DD11.18(PA13) X11.1
NetHL1_1: HL1.1(C) R133.2
NetHL2_1: HL2.1(C) R134.2
NetHL3_1: HL3.1(C) R135.2
NetHL4_1: HL4.1(C) R136.2
NetHL5_1: HL5.1(C) R137.2
NetHL6_1: HL6.1(C) R138.2
NetHL7_1: HL7.1(C) R139.2
NetHL8_1: HL8.1(C) R140.2
NetHL9_1: HL9.1(C) R141.2
NetHL10_1: HL10.1(C) R142.2
NetHL11_1: HL11.1(C) R143.2
NetHL12_1: HL12.1(C) R144.2
NetHL13_1: HL13.1(C) R145.2
NetHL14_1: HL14.1(C) R146.2
NetHL15_1: HL15.1(C) R147.2
NetHL16_1: HL16.1(C) R148.2
NetHL17_1: HL17.1(C) R149.2
NetHL18_1: HL18.1(C) R150.2
NetHL19_1: HL19.1(C) R151.2
NetHL20_1: HL20.1(C) R152.2
NetHL21_1: HL21.1(C) R153.2
NetHL22_1: HL22.1(C) R154.2
NetHL23_1: HL23.1(C) R155.2
NetHL24_1: HL24.1(C) R156.2
NetHL25_2: HL25.2(A) R157.2
NetHL26_2: HL26.2(A) R158.2
NetR133_1: R133.1 VT9.18(1C)
NetR134_1: R134.1 VT9.17(2C)
NetR135_1: R135.1 VT9.16(3C)
NetR136_1: R136.1 VT9.15(4C)
NetR137_1: R137.1 VT9.14(5C)
NetR138_1: R138.1 VT9.13(6C)
NetR139_1: R139.1 VT9.12(7C)
NetR140_1: R140.1 VT9.11(8C)
NetR141_1: R141.1 VT10.18(1C)
NetR142_1: R142.1 VT10.17(2C)
NetR143_1: R143.1 VT10.16(3C)
NetR144_1: R144.1 VT10.15(4C)
NetR145_1: R145.1 VT10.14(5C)
NetR146_1: R146.1 VT10.13(6C)
NetR147_1: R147.1 VT10.12(7C)
NetR148_1: R148.1 VT10.11(8C)
NetR149_1: R149.1 VT11.18(1C)
NetR150_1: R150.1 VT11.17(2C)
NetR151_1: R151.1 VT11.16(3C)
NetR152_1: R152.1 VT11.15(4C)
NetR153_1: R153.1 VT11.14(5C)
NetR154_1: R154.1 VT11.13(6C)
NetR155_1: R155.1 VT11.12(7C)
NetR156_1: R156.1 VT11.11(8C)
NetR162_1: R162.1 XP1.2
NetR163_1: R163.1 XP1.5
NetR164_1: R164.1 XP1.4
NetR165_1: R165.1 R169.2 S1.1 S1.4
NetR166_1: R166.1 R170.2 S2.1 S2.4
NetR167_1: R167.1 R171.2 S3.1 S3.4
NetR168_1: R168.1 R172.2 S4.1 S4.4

Not connected (* = marked no-connect by the designer): DD10 7(Q̅H̅); DD12 2(Vss) 5(Vdd); DD13 2(Vss) 5(Vdd); S1 3; S2 3; S3 3; S4 3; X5 2; XP1 3

### Layout directives
net class HighVoltage1; rule Creepage Distance [Distance constraint 2.5mm]: (no net found under the mark)
net class HighVoltage2; rule Creepage Distance [Distance constraint 2.5mm]: (no net found under the mark)

### Notes on the sheet
- Контакт 1
- Контакт 2
- Контакт 3
- Контакт 4
- Контакт 5
- Контакт 6
- Контакт 7
- (near XP1) +3,3 В
- (near XP1) RESET
- Контакт 8
- (near XP1) SWCLK
- (near XP1) SWO
- Контакт 9
- (near XP1) GND
- (near XP1) SWDIO
- Контакт 10
- Контакт 11
- Контакт 12
- Контакт 13
- Контакт 14
- (near S1) Старт
- Контакт 15
- Контакт 16
- Выбор режима
- Годен
- Брак
- Работа
- (near S3) Сброс
- N
- 220 В
- Готов
- Режим 1
- (near S4) Резерв
- Режим 2
- Режим 3
- Режим 4
- Перв. примен.
- Справ. №
- Подп. и дата
- Инв. № дубл.
- Взам. инв. №
- Инв. № подл.
- Лист
- Копировал
- Формат  A2
- (in symbol 3 pins (Right)) Цепь; Конт.
- (in symbol 6 pins (Left)) Конт.; Цепь
- (in symbol 74HC164) RG
- (in symbol 74HC165) RG
- (in symbol MFM-05) AC/DC
- (in symbol STM32G030F6P6) MCU
- (in symbol ULN2803) MTR

### Library data of the parts
A1 = MFM-05: IRM-15-5 (AC/DC преобразователь)
C7-C9 C12 C16 C21 C22 = Конденсатор: C0603 0,1 мкФ 50В X7R
C10 C11 C13 C14 = Конденсатор: C0603 10 мкФ 25В X5R
C15 = Конденсатор: C0603 4,7 мкФ 25В X5R
C17-C20 = Конденсатор: C0603 0,01 мкФ 25В X7R
DA1 = L7805CD
DD7-DD9 = 74HC164: 74HCT164D (SOIC-14)
DD10 = 74HC165: 74HCT165D (SOIC-16) /
DD11 = STM32G030F6P6: Manufacturer: STMicroelectronics(ST); Value: STM32G030F6P6; Price: 58; HelpURL: https://lcsc.com/product-detail/ST-Microelectronics_STMicroelectronics-STM32G030F6P6TR_C529330.html; Case: TSSOP-20
DD12 DD13 = 74LVC2G17: SN74LVC2G17DBVR
HL1-HL16 HL18 = Светодиод: GNL-5013ED-E
HL17 HL19-HL26 = Светодиод: GNL-5013GD
R133-R148 R150 = Резистор: R0805 220 Ом ±5%
R149 R151-R157 = Резистор: R0805 150 Ом ±5%
R158 = Резистор: R0805 330 Ом ±5%
R159-R161 R169-R172 = Резистор: R0805 10 кОм ±5%
R162-R164 = Резистор: R0603 100 Ом ±5%
R165-R168 = Резистор: R0805 1 кОм ±5%
S1-S4 = Кнопка 1
VT9-VT11 = ULN2803: ULN2803 (SOP-18W)
X5 = 3 pins (Right): 5EHDV-03P + 5ESDV-03P
X6-X11 = 1 pin
XP1 = 6 pins (Left)

## Nets that join several sheets
5V: Схема проверки шлейфа (46 pins), Проц, ввод вывод, питание (47 pins)
DATA1_165: Схема проверки шлейфа (DD2.9), Проц, ввод вывод, питание (DD12.1)
DATA2_165: Схема проверки шлейфа (DD5.9), Проц, ввод вывод, питание (DD12.3)
DATA_164: Схема проверки шлейфа (DD3.1 DD3.2 R60.2), Проц, ввод вывод, питание (DD11.1)
GND: Схема проверки шлейфа (70 pins), Проц, ввод вывод, питание (38 pins)
SCL_164: Схема проверки шлейфа (DD3.8 DD6.8 R57.2), Проц, ввод вывод, питание (DD11.2)
SCL_165_1: Схема проверки шлейфа (DD1.2 DD2.2 R37.2), Проц, ввод вывод, питание (DD11.10)
SCL_165_2: Схема проверки шлейфа (DD4.2 DD5.2 R52.2), Проц, ввод вывод, питание (DD11.14)
SH/~{LD}_1: Схема проверки шлейфа (DD1.1 DD2.1), Проц, ввод вывод, питание (DD11.9)
SH/~{LD}_2: Схема проверки шлейфа (DD4.1 DD5.1), Проц, ввод вывод, питание (DD11.13)